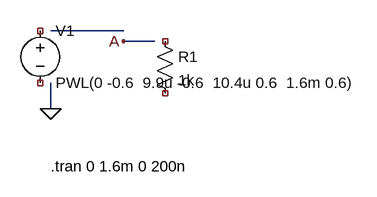
[diagram p0: schematic mini.asc]
mini.asc, the LTspice schematic file:
Version 4
SHEET 1 880 680
WIRE 176 208 224 208
WIRE 64 192 176 192
WIRE 64 272 64 312
SYMBOL voltage 48 176 R0
SYMATTR InstName V1
SYMATTR Value PWL(0 -0.6  9.9u -0.6  10.4u 0.6  1.6m 0.6)
SYMBOL res 224 192 R0
SYMATTR InstName R1
SYMATTR Value 1k
FLAG 64 312 0
FLAG 176 208 A
TEXT 64 400 Left 2 !.tran 0 1.6m 0 200n

The netlist it stands for:
* mini.asc
V1 NC_01 NC_02 PWL(0 -0.6  9.9u -0.6  10.4u 0.6  1.6m 0.6)
R1 NC_03 NC_04 1k
.tran 0 1.6m 0 200n
.backanno
.end